# Altium project lga1700.PrjPCB (part 10 of 11)

## Sheet SIO - IT8613E.schdoc
size 420 x 298 mm; Symbol: Sheet-Symbol_A3; Company: 嘉立创EDA; Version: V1.0; Page Size: A3; @Project Name: 【全网首发】X86电脑主板_copy; @Page Count: 12; @Update Date: 2025-10-09; @Create Date: 2025-10-09; @Schematic Name: SCHEMATIC1_1; @Page No: 0; @Page Name: SIO - IT8613E; Device: Sheet-Symbol_A3
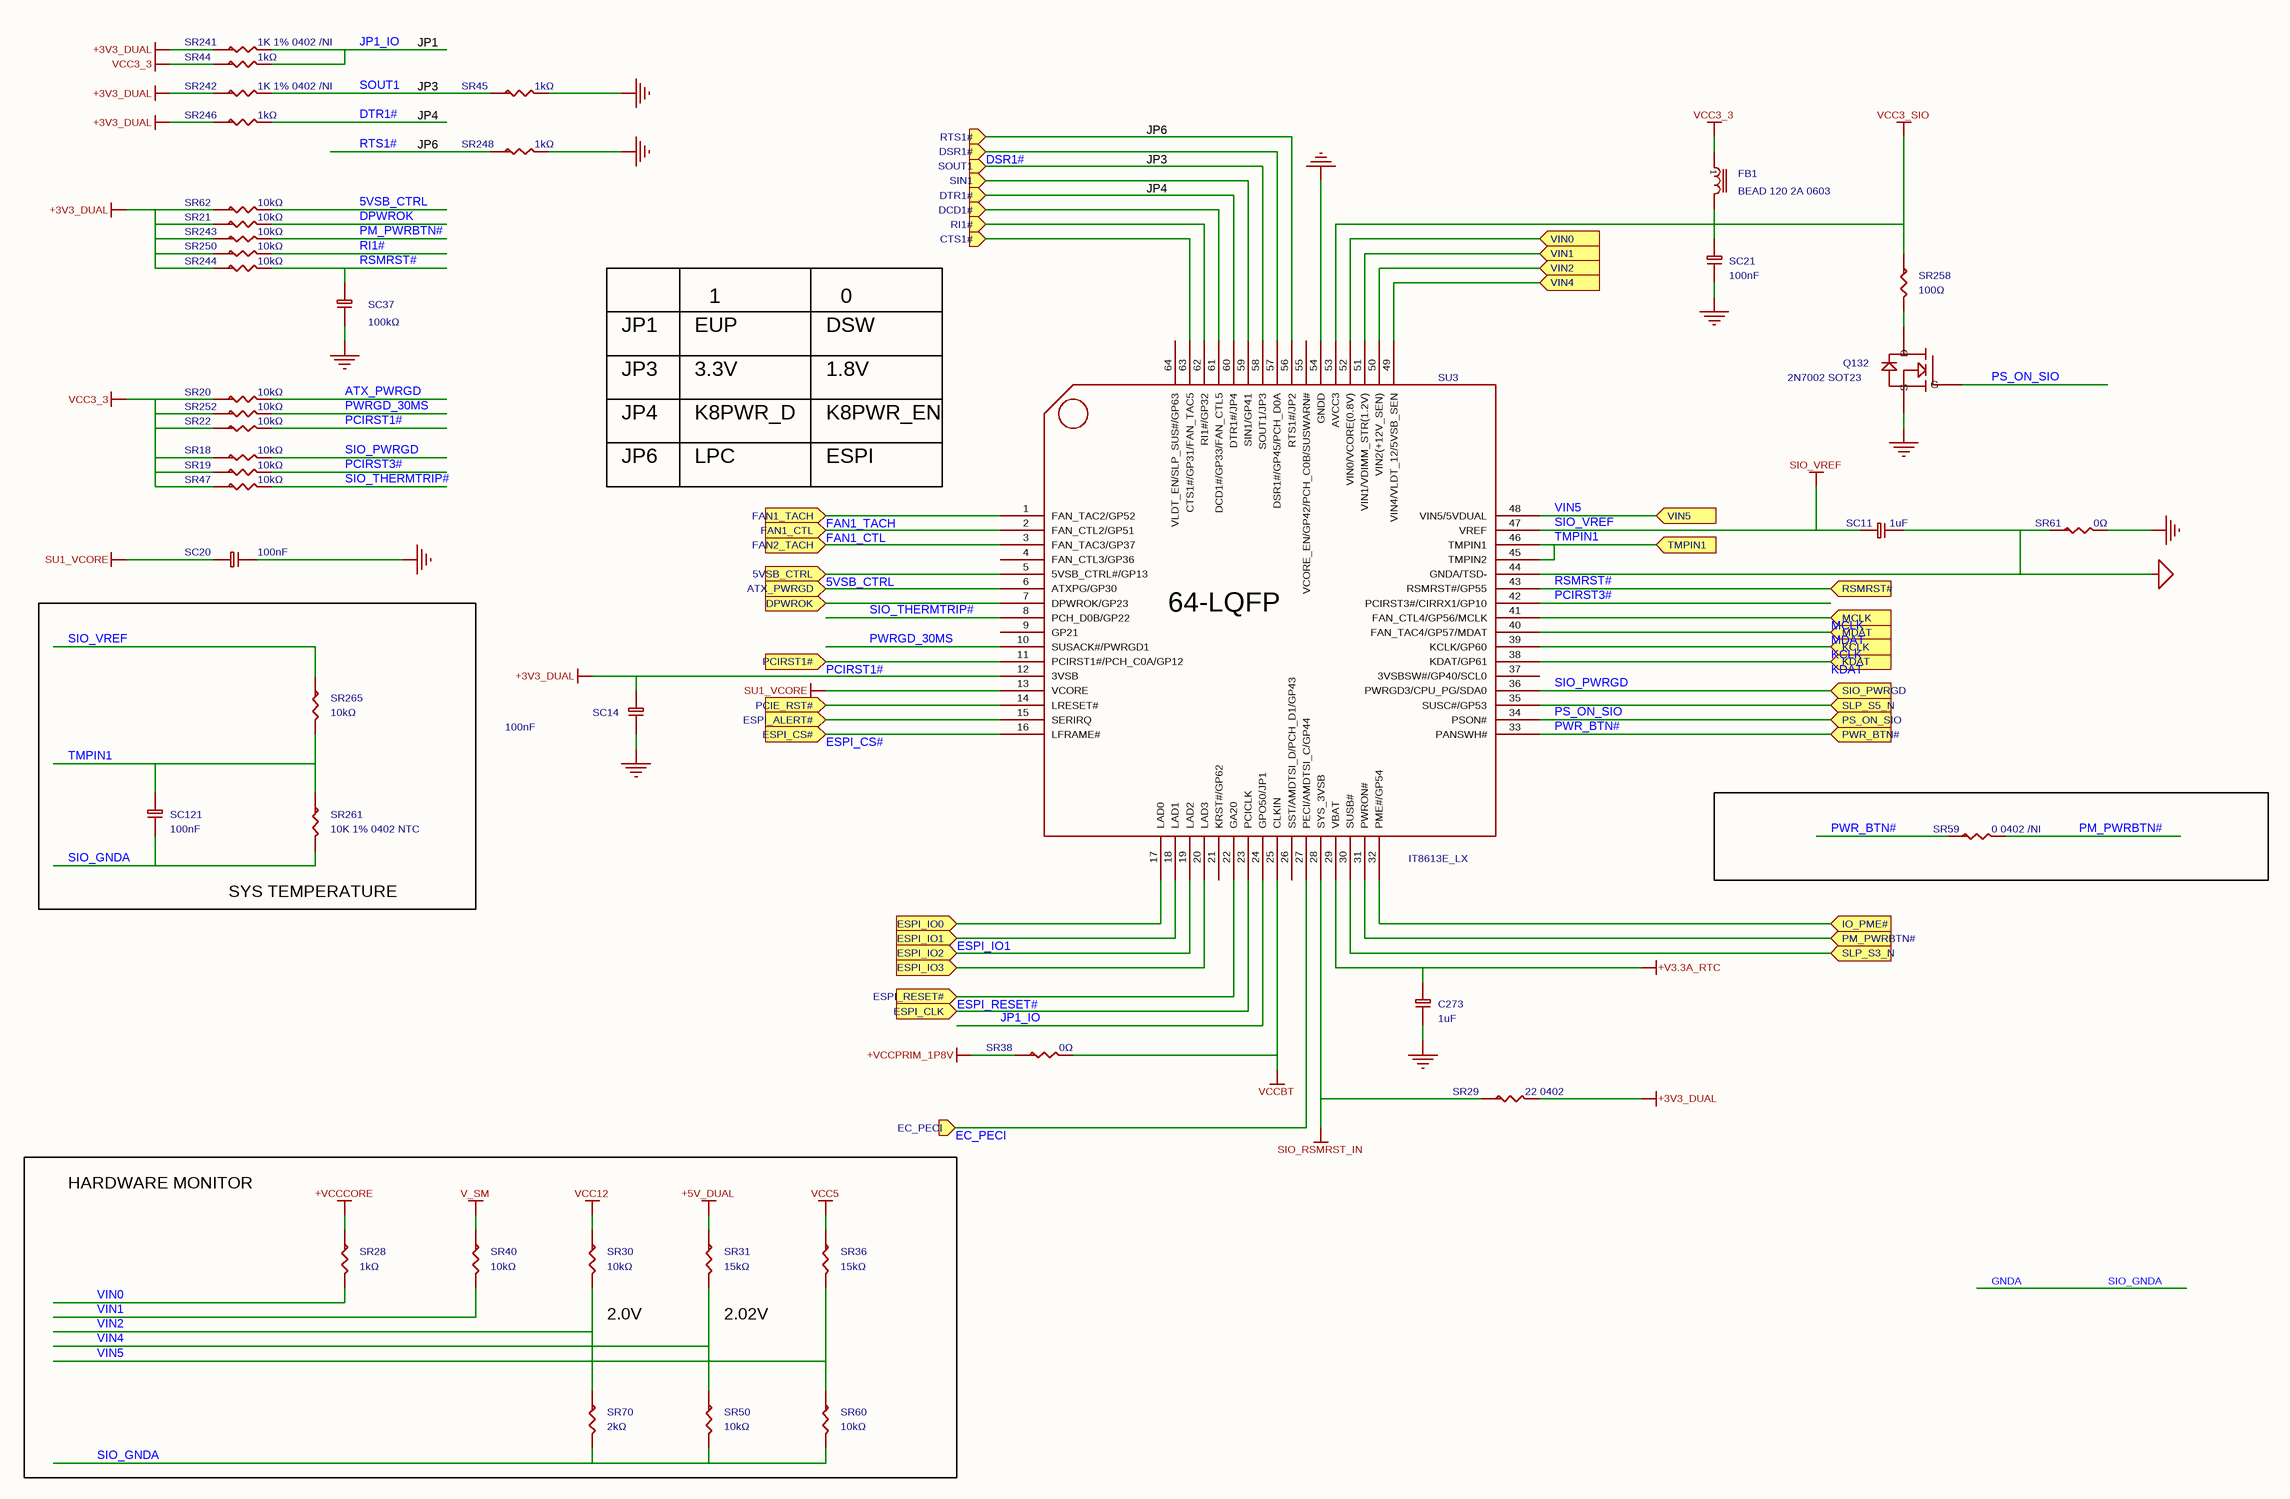
[diagram p30: SIO - IT8613E.schdoc]

### Parts
C273  1uF  [C0402]
FB1  value BEAD 120 2A 0603  [FB0603_1]  (hidden comment: FERRITE BEAD)
Q132  value 2N7002 SOT23  [SOT23_123]  (hidden comment: 2N7002)
SC11  1uF  [C0402]
SC14  100nF  [C0402_2]
SC20  100nF  [C0402_1]
SC21  100nF  [C0402]
SC37  100kΩ  [C0402]
SC121  100nF  [C0402]
SR18  10kΩ  [R0402_2]
SR19  10kΩ  [R0402_3]
SR20  10kΩ  [R0402]
SR21  10kΩ  [R0402]
SR22  10kΩ  [R0402]
SR28  1kΩ  [R0402_2]
SR29  value 22 0402  [R0402_3]  (hidden comment: R-0603)
SR30  10kΩ  [R0402_2]
SR31  15kΩ  [R0402_2]
SR36  15kΩ  [R0402_2]
SR38  0Ω  [R0402_1]
SR40  10kΩ  [R0402_2]
SR44  1kΩ  [R0402_3]
SR45  1kΩ  [R0402_2]
SR47  10kΩ  [R0402_1]
SR50  10kΩ  [R0402]
SR59  value 0 0402 /NI  [R0402]  (hidden comment: R-0603)
SR60  10kΩ  [R0402]
SR61  0Ω  [R0402]
SR62  10kΩ  [R0402]
SR70  2kΩ  [R0402_2]
SR241  value 1K 1% 0402 /NI  [R0402_3]  (hidden comment: R-0603)
SR242  value 1K 1% 0402 /NI  [R0402]  (hidden comment: R-0603)
SR243  10kΩ  [R0402_2]
SR244  10kΩ  [R0402_2]
SR246  1kΩ  [R0402_2]
SR248  1kΩ  [R0402]
SR250  10kΩ  [R0402_2]
SR252  10kΩ  [R0402_1]
SR258  100Ω  [R0402]
SR261  value 10K 1% 0402 NTC  [R0402]  (hidden comment: NCP15XH103F03RC)
SR265  10kΩ  [R0402]
SU3  value IT8613E_LX  [LQFP64_0_4]  (hidden comment: IT8712H_AP_0)

### Blocks framed on the sheet
SYS TEMPERATURE: SC121 SR261 SR265

### Ports
5VSB_CTRL (in), ATX_PWRGD (in), CTS1# (in), DCD1# (in), DPWROK (in), DSR1# (in), DTR1# (in), EC_PECI (in), ESPI_ALERT# (in), ESPI_CLK (in), ESPI_CS# (in), ESPI_IO0 (in), ESPI_IO1 (in), ESPI_IO2 (in), ESPI_IO3 (in), ESPI_RESET# (in), FAN1_CTL (in), FAN1_TACH (in), FAN2_TACH (in), IO_PME# (in), KCLK (in), KDAT (in), MCLK (in), MDAT (in), PCIE_RST# (in), PCIRST1# (in), PM_PWRBTN# (in), PS_ON_SIO (in), PWR_BTN# (in), RI1# (in), RSMRST# (in), RTS1# (in), SIN1 (in), SIO_PWRGD (in), SLP_S3_N (in), SLP_S5_N (in), SOUT1 (in), TMPIN1 (in), VIN0 (in), VIN1 (in), VIN2 (in), VIN4 (in), VIN5 (in)

### Nets
+3V3_DUAL: SC14.2 SR21.1 SR29.2 SR62.1 SR241.1 SR242.1 SR243.1 SR244.1 SR246.1 SR250.1 SU3.12(3VSB)
+5V_DUAL: SR31.1
+V3.3A_RTC: C273.2 SU3.29(VBAT)
+VCCCORE: SR28.1
+VCCPRIM_1P8V: SR38.1
GND: C273.1 Q132.2(S) SC14.1 SC20.1 SC21.1 SC37.1 SR45.2 SR61.2 SR248.2 SU3.54(GNDD)
GNDA: SC11.1 SC121.1 SR50.2 SR60.2 SR61.1 SR70.2 SR261.2 SU3.44(GNDA/TSD-)  [also labelled SIO_GNDA]
SIO_RSMRST_IN: SR29.1 SU3.28(SYS_3VSB)
SIO_VREF: SC11.2 SR265.1 SU3.47(VREF)
SU1_VCORE: SC20.2 SU3.13(VCORE)
V_SM: SR40.1
VCC3_3: FB1.1 SR18.1 SR19.1 SR20.1 SR22.1 SR44.1 SR47.1 SR252.1
VCC3_SIO: FB1.2 SC21.2 SR258.1 SU3.53(AVCC3)
VCC5: SR36.1
VCC12: SR30.1
VCCBT: SR38.2 SU3.25(CLKIN)
5VSB_CTRL: SR62.2 SU3.5(5VSB_CTRL#/GP13) ; port 5VSB_CTRL
ATX_PWRGD: SR20.2
CTS1#: SU3.63(CTS1#/GP31/FAN_TAC5) ; port CTS1#
DCD1#: SU3.61(DCD1#/GP33/FAN_CTL5) ; port DCD1#
DPWROK: SU3.7(DPWROK/GP23) ; port DPWROK
DPWROK: SR21.2  [a separate net that carries the same name]
DSR1#: SU3.57(DSR1#/GP45/PCH_D0A) ; port DSR1#
DTR1#: SU3.60(DTR1#/JP4) ; port DTR1#
DTR1#: SR246.2  [a separate net that carries the same name]
EC_PECI: SU3.27(PECI/AMDTSI_C/GP44) ; port EC_PECI
ESPI_CS#: SU3.16(LFRAME#) ; port ESPI_CS#
ESPI_IO1: SU3.18(LAD1) ; port ESPI_IO1
ESPI_RESET#: SU3.22(GA20) ; port ESPI_RESET#
FAN1_CTL: SU3.2(FAN_CTL2/GP51) ; port FAN1_CTL
FAN1_TACH: SU3.1(FAN_TAC2/GP52) ; port FAN1_TACH
IO_PME#: SU3.32(PME#/GP54) ; port IO_PME#
JP1_IO: SR44.2 SR241.2 SU3.24(GPO50/JP1)
KCLK: SU3.39(KCLK/GP60) ; port KCLK
KDAT: SU3.38(KDAT/GP61) ; port KDAT
MCLK: SU3.41(FAN_CTL4/GP56/MCLK) ; port MCLK
MDAT: SU3.40(FAN_TAC4/GP57/MDAT) ; port MDAT
PCIE_RST#: SU3.14(LRESET#) ; port PCIE_RST#
PCIRST1#: SR22.2 SU3.11(PCIRST1#/PCH_C0A/GP12) ; port PCIRST1#
PCIRST3#: SR19.2 SU3.42(PCIRST3#/CIRRX1/GP10)
PM_PWRBTN#: SU3.31(PWRON#) ; port PM_PWRBTN#
PM_PWRBTN#: SR59.2 SR243.2  [a separate net that carries the same name]
PS_ON_SIO: Q132.1(G) SU3.34(PSON#) ; port PS_ON_SIO
PWR_BTN#: SR59.1 SU3.33(PANSWH#) ; port PWR_BTN#
PWRGD_30MS: SR252.2 SU3.10(SUSACK#/PWRGD1)
RI1#: SU3.62(RI1#/GP32) ; port RI1#
RI1#: SR250.2  [a separate net that carries the same name]
RSMRST#: SC37.2 SR244.2 SU3.43(RSMRST#/GP55) ; port RSMRST#
RTS1#: SU3.56(RTS1#/JP2) ; port RTS1#
RTS1#: SR248.1  [a separate net that carries the same name]
SIN1: SU3.59(SIN1/GP41) ; port SIN1
SIO_PWRGD: SR18.2 SU3.36(PWRGD3/CPU_PG/SDA0) ; port SIO_PWRGD
SIO_THERMTRIP#: SR47.2 SU3.8(PCH_D0B/GP22)
SLP_S3_N: SU3.30(SUSB#) ; port SLP_S3_N
SOUT1: SR45.1 SR242.2
TMPIN1: SC121.2 SR261.1 SR265.2 SU3.45(TMPIN2) SU3.46(TMPIN1) ; port TMPIN1
VIN0: SR28.2
VIN1: SR40.2
VIN2: SR30.2 SR70.1
VIN4: SR31.2 SR50.1
VIN5: SR36.2 SR60.1 SU3.48(VIN5/5VDUAL) ; port VIN5
NetATXPWR1_8: SU3.6(ATXPG/GP30) ; port ATX_PWRGD
NetPCH2_AN4: SU3.35(SUSC#/GP53) ; port SLP_S5_N
NetQ132_3: Q132.3(D) SR258.2
NetSU3_3: SU3.3(FAN_TAC3/GP37) ; port FAN2_TACH
NetSU3_15: SU3.15(SERIRQ) ; port ESPI_ALERT#
NetSU3_17: SU3.17(LAD0) ; port ESPI_IO0
NetSU3_19: SU3.19(LAD2) ; port ESPI_IO2
NetSU3_20: SU3.20(LAD3) ; port ESPI_IO3
NetSU3_23: SU3.23(PCICLK) ; port ESPI_CLK
NetSU3_49: SU3.49(VIN4/VLDT_12/5VSB_SEN) ; port VIN4
NetSU3_50: SU3.50(VIN2(+12V_SEN)) ; port VIN2
NetSU3_51: SU3.51(VIN1/VDIMM_STR(1.2V)) ; port VIN1
NetSU3_52: SU3.52(VIN0/VCORE(0.8V)) ; port VIN0
NetSU3_58: SU3.58(SOUT1/JP3) ; port SOUT1

Not connected (* = marked no-connect by the designer): SU3 4(FAN_CTL3/GP36) 9(GP21) 21(KRST#/GP62) 26(SST/AMDTSI_D/PCH_D1/GP43) 37(3VSBSW#/GP40/SCL0) 55(VCORE_EN/GP42/PCH_C0B/SUSWARN#) 64(VLDT_EN/SLP_SUS#/GP63)

### Notes on the sheet
- JP1
- JP3
- JP4
- JP6
- EUP
- 1
- DSW
- 0
- 3.3V
- K8PWR_D
- 1.8V
- K8PWR_EN
- LPC
- ESPI
- HARDWARE MONITOR
- (near SR30) 2.0V
- (near SR31) 2.02V
- 更新日期
- 2025-10-09
- 原理图
- 图页
- SCHEMATIC1_1
- SIO - IT8613E
- 创建日期
- 物料编码
- 审阅
- 绘制
- 【全网首发】X86电脑主板_copy
- 版本
- V1.0
- 尺寸
- A3
- 页
- 嘉立创EDA
- 共
- 12
- (in symbol IT8712H_AP_0) 64-LQFP

### Library data of the parts
C273 SC11 = CL05A105KQ5NNNC: 容值:1uF;精度:±10%;额定电压:6.3V;材质(温度系数):X5R;; Manufacturer: SAMSUNG(三星); Symbol: C-0603_2; AddInBom: yes; ModelId: 36a51122f27c49738f86b3bfa98863e0; ModelName: C0402_L1.0-W0.5-H0.5; ModelTransform: 39.37,19.685,0,0,0,0,0,0,0; Tolerance: ±10%; Voltage Rated: 6.3V; Temperature Coefficient: X5R; Device: CL05A105KQ5NNNC; Value: 1uF; LCSC Part Name: 1uF ±10% 6.3V; SupplierPart: C107372; ManufacturerPart: CL05A105KQ5NNNC; Supplier Footprint: 0402; JLCPCB Part Class: Extended Part; Datasheet: https://atta.szlcsc.com/upload/public/pdf/source/20160218/1457707763339.pdf; Supplier: LCSC; ConvertToPcb: yes; FootprintName: C0402
FB1 = FERRITE BEAD_2: Check: false; AddInBom: yes; Device: FERRITE BEAD_2; Symbol: FERRITE BEAD; FootprintName: FB0603_1; ConvertToPcb: yes
Q132 = 2N7002_C8545: 类型:N沟道;漏源电压(Vdss):60V;连续漏极电流(Id):115mA;功率(Pd):200mW;导通电阻(RDS(on)@Vgs,Id):7.5Ω@10V,500mA;阈值电压(Vgs(th)@Id):2.5V@250uA;; Manufacturer: CJ(江苏长电/长晶); Symbol: MOS,2N7002,SOT23,60V,300mA_0; Type: N沟道; ModelId: c62791f0466c4ae2a892c056b845b0ca; AddInBom: yes; ModelName: SOT-23-3P_L2.9-W1.3-H1.0-LS2.4-P0.95; ModelTransform: 98.425,114.173,0,180,0,0,0.0005,-0.0005,0; Power Dissipation (Pd): 200mW; Drain Source Voltage (Vdss): 60V; Continuous Drain Current (Id): 115mA; Device: 2N7002_C8545; Supplier: LCSC; Datasheet: https://atta.szlcsc.com/upload/public/pdf/source/20170302/1488422688078.pdf; FootprintName: SOT23_123; SupplierPart: C8545; ConvertToPcb: yes; LCSC Part Name: N沟道 60V 115mA; JLCPCB Part Class: Basic Part; ManufacturerPart: 2N7002; Supplier Footprint: SOT-23; Gate Threshold Voltage (Vgs(th)@Id): 2.5V@250uA; Drain Source On Resistance (RDS(on)@Vgs,Id): 7.5Ω@10V,500mA
SC14 SC20 SC21 SC121 = CL05B104KO5NNNC: 容值:100nF;精度:±10%;额定电压:16V;材质(温度系数):X7R;; Manufacturer: SAMSUNG(三星); Symbol: C-0603_2; ModelId: 36a51122f27c49738f86b3bfa98863e0; Tolerance: ±10%; AddInBom: yes; Voltage Rated: 16V; ModelName: C0402_L1.0-W0.5-H0.5; ModelTransform: 39.37,19.685,0,0,0,0,0,0,0; Temperature Coefficient: X7R; Device: CL05B104KO5NNNC; Value: 100nF; Supplier: LCSC; Datasheet: https://atta.szlcsc.com/upload/public/pdf/source/20160103/1457707674891.pdf; SupplierPart: C1525; ConvertToPcb: yes; LCSC Part Name: 100nF ±10% 16V; JLCPCB Part Class: Basic Part; ManufacturerPart: CL05B104KO5NNNC; Supplier Footprint: 0402
  SC14: FootprintName: C0402_2
  SC20: FootprintName: C0402_1
  SC21 SC121: FootprintName: C0402
SC37 = 0402WGF1003TCE: 电阻类型:厚膜电阻;阻值:100kΩ;精度:±1%;功率:62.5mW;; Manufacturer: UNI-ROYAL(厚声); Symbol: C-0603_0; ModelId: 671aefced39d4c318694bba8bd8efd39; Tolerance: ±1%; AddInBom: yes; Power(Watts): 62.5mW; ModelName: R0402_L1.0-W0.5-H0.5; ModelTransform: 39.37,19.685,0,0,0,0,0,0.0005,0; Overload Voltage (Max): 50V; Temperature Coefficient: ±100ppm/℃; Device: 0402WGF1003TCE; Value: 100kΩ; Type: 厚膜电阻; Supplier: LCSC; Datasheet: https://atta.szlcsc.com/upload/public/pdf/source/20200306/C422600_1E6D84923E4A46A82E41ADD87F860B5C.pdf; FootprintName: C0402; SupplierPart: C25741; ConvertToPcb: yes; LCSC Part Name: 100kΩ ±1% 62.5mW; JLCPCB Part Class: Basic Part; ManufacturerPart: 0402WGF1003TCE; Supplier Footprint: 0402; Operating Temperature Range: -55℃~+155℃
SR18-SR22 SR30 SR40 SR47 SR50 SR60 SR62 SR243 SR244 SR250 SR252 SR265 = 0402WGF1002TCE: 电阻类型:厚膜电阻;阻值:10kΩ;精度:±1%;功率:62.5mW;; Manufacturer: UNI-ROYAL(厚声); Symbol: R-0603; ModelId: 671aefced39d4c318694bba8bd8efd39; Tolerance: ±1%; AddInBom: yes; Power(Watts): 62.5mW; ModelName: R0402_L1.0-W0.5-H0.5; ModelTransform: 39.37,19.685,0,0,0,0,0,0.0005,0; Overload Voltage (Max): 50V; Temperature Coefficient: ±100ppm/℃; Device: 0402WGF1002TCE; Value: 10kΩ; Type: 厚膜电阻; Supplier: LCSC; Datasheet: https://atta.szlcsc.com/upload/public/pdf/source/20200306/C422600_1E6D84923E4A46A82E41ADD87F860B5C.pdf; SupplierPart: C25744; ConvertToPcb: yes; LCSC Part Name: 10kΩ ±1% 62.5mW; JLCPCB Part Class: Basic Part; ManufacturerPart: 0402WGF1002TCE; Supplier Footprint: 0402; Operating Temperature Range: -55℃~+155℃
  SR18 SR30 SR40 SR243 SR244 SR250: FootprintName: R0402_2
  SR19: FootprintName: R0402_3
  SR20-SR22 SR50 SR60 SR62 SR265: FootprintName: R0402
  SR47 SR252: FootprintName: R0402_1
SR28 SR44 SR45 SR246 SR248 = 0402WGF1001TCE: 电阻类型:厚膜电阻;阻值:1kΩ;精度:±1%;功率:62.5mW;; Manufacturer: UNI-ROYAL(厚声); Symbol: R-0603; ModelId: 671aefced39d4c318694bba8bd8efd39; Tolerance: ±1%; AddInBom: yes; Power(Watts): 62.5mW; ModelName: R0402_L1.0-W0.5-H0.5; ModelTransform: 39.37,19.685,0,0,0,0,0,0.0005,0; Overload Voltage (Max): 50V; Temperature Coefficient: ±100ppm/℃; Device: 0402WGF1001TCE; Value: 1kΩ; Type: 厚膜电阻; Supplier: LCSC; Datasheet: https://atta.szlcsc.com/upload/public/pdf/source/20200306/C422600_1E6D84923E4A46A82E41ADD87F860B5C.pdf; SupplierPart: C11702; ConvertToPcb: yes; LCSC Part Name: 1kΩ ±1% 62.5mW; JLCPCB Part Class: Basic Part; ManufacturerPart: 0402WGF1001TCE; Supplier Footprint: 0402; Operating Temperature Range: -55℃~+155℃
  SR28 SR45 SR246: FootprintName: R0402_2
  SR44: FootprintName: R0402_3
  SR248: FootprintName: R0402
SR29 = R-0603: AddInBom: yes; Device: R-0603; Symbol: R-0603; FootprintName: R0402_3; ConvertToPcb: yes
SR31 SR36 = 0402WGF1502TCE: 电阻类型:厚膜电阻;阻值:15kΩ;精度:±1%;功率:62.5mW;; Manufacturer: UNI-ROYAL(厚声); Symbol: R-0603; ModelId: 671aefced39d4c318694bba8bd8efd39; Tolerance: ±1%; AddInBom: yes; Power(Watts): 62.5mW; ModelName: R0402_L1.0-W0.5-H0.5; ModelTransform: 39.37,19.685,0,0,0,0,0,0.0005,0; Overload Voltage (Max): 50V; Temperature Coefficient: ±100ppm/℃; Device: 0402WGF1502TCE; Value: 15kΩ; Type: 厚膜电阻; Supplier: LCSC; Datasheet: https://atta.szlcsc.com/upload/public/pdf/source/20200306/C422600_1E6D84923E4A46A82E41ADD87F860B5C.pdf; FootprintName: R0402_2; SupplierPart: C25756; ConvertToPcb: yes; LCSC Part Name: 15kΩ ±1% 62.5mW; JLCPCB Part Class: Basic Part; ManufacturerPart: 0402WGF1502TCE; Supplier Footprint: 0402; Operating Temperature Range: -55℃~+155℃
SR38 SR61 = 0402WGF0000TCE: 电阻类型:厚膜电阻;阻值:0Ω;精度:±1%;功率:62.5mW;; Manufacturer: UNI-ROYAL(厚声); Symbol: R-0603; ModelId: 671aefced39d4c318694bba8bd8efd39; Tolerance: ±1%; AddInBom: yes; Power(Watts): 62.5mW; ModelName: R0402_L1.0-W0.5-H0.5; ModelTransform: 39.37,19.685,0,0,0,0,0,0.0005,0; Overload Voltage (Max): 50V; Temperature Coefficient: ±800ppm/℃; Device: 0402WGF0000TCE; Value: 0Ω; Type: 厚膜电阻; Supplier: LCSC; Datasheet: https://atta.szlcsc.com/upload/public/pdf/source/20200306/C422600_1E6D84923E4A46A82E41ADD87F860B5C.pdf; SupplierPart: C17168; ConvertToPcb: yes; LCSC Part Name: 0Ω ±1% 62.5mW; JLCPCB Part Class: Basic Part; ManufacturerPart: 0402WGF0000TCE; Supplier Footprint: 0402; Operating Temperature Range: -55℃~+155℃
  SR38: FootprintName: R0402_1
  SR61: FootprintName: R0402
SR59 SR242 = R-0603_1: Check: false; AddInBom: yes; Device: R-0603_1; Symbol: R-0603; FootprintName: R0402; ConvertToPcb: yes
SR70 = 0402WGF2001TCE: 电阻类型:厚膜电阻;阻值:2kΩ;精度:±1%;功率:62.5mW;; Manufacturer: UNI-ROYAL(厚声); Symbol: R-0603; ModelId: 671aefced39d4c318694bba8bd8efd39; Tolerance: ±1%; AddInBom: yes; Power(Watts): 62.5mW; ModelName: R0402_L1.0-W0.5-H0.5; ModelTransform: 39.37,19.685,0,0,0,0,0,0.0005,0; Overload Voltage (Max): 50V; Temperature Coefficient: ±100ppm/℃; Device: 0402WGF2001TCE; Value: 2kΩ; Type: 厚膜电阻; Supplier: LCSC; Datasheet: https://atta.szlcsc.com/upload/public/pdf/source/20200306/C422600_1E6D84923E4A46A82E41ADD87F860B5C.pdf; FootprintName: R0402_2; SupplierPart: C4109; ConvertToPcb: yes; LCSC Part Name: 2kΩ ±1% 62.5mW; JLCPCB Part Class: Basic Part; ManufacturerPart: 0402WGF2001TCE; Supplier Footprint: 0402; Operating Temperature Range: -55℃~+155℃
SR241 = R-0603: Check: false; AddInBom: yes; Device: R-0603; Symbol: R-0603; FootprintName: R0402_3; ConvertToPcb: yes
SR258 = 0402WGF1000TCE: 电阻类型:厚膜电阻;阻值:100Ω;精度:±1%;功率:62.5mW;; Manufacturer: UNI-ROYAL(厚声); Symbol: R-0603; ModelId: 671aefced39d4c318694bba8bd8efd39; Tolerance: ±1%; AddInBom: yes; Power(Watts): 62.5mW; ModelName: R0402_L1.0-W0.5-H0.5; ModelTransform: 39.37,19.685,0,0,0,0,0,0.0005,0; Overload Voltage (Max): 50V; Temperature Coefficient: ±200ppm/℃; Device: 0402WGF1000TCE; Value: 100Ω; Type: 厚膜电阻; Supplier: LCSC; Datasheet: https://atta.szlcsc.com/upload/public/pdf/source/20200306/C422600_1E6D84923E4A46A82E41ADD87F860B5C.pdf; FootprintName: R0402; SupplierPart: C25076; ConvertToPcb: yes; LCSC Part Name: 100Ω ±1% 62.5mW; JLCPCB Part Class: Basic Part; ManufacturerPart: 0402WGF1000TCE; Supplier Footprint: 0402; Operating Temperature Range: -55℃~+155℃
SR261 = NCP15XH103F03RC: 阻值(25℃):10kΩ;B值(25℃/50℃):3380K;电阻精度:±1%;功率:100mW;B值精度:±1%;最大稳态电流(25℃):310uA;; Manufacturer: muRata(村田); Symbol: R-0603; AddInBom: yes; ModelId: 671aefced39d4c318694bba8bd8efd39; ModelName: R0402_L1.0-W0.5-H0.5; ModelTransform: 39.37,19.685,0,0,0,0,0,0.0005,0; Resistance @ 25℃: 10kΩ; B Constant (25℃/50℃): 3380K; Resistance Tolerance: ±1%; B Constant (25℃/85℃): 3434K; B Constant (25℃/100℃): 3455K; Power: 100mW; Steady State Current (Max): 310uA; Device: NCP15XH103F03RC; LCSC Part Name: 10kΩ 电阻精度:±1% 3380K; SupplierPart: C77131; ManufacturerPart: NCP15XH103F03RC; Supplier Footprint: 0402; JLCPCB Part Class: Extended Part; Datasheet: https://atta.szlcsc.com/upload/public/pdf/source/20191017/C437581_F6360BF8E6A38281D0EED84DF6C92458.pdf; Supplier: LCSC; ConvertToPcb: yes; FootprintName: R0402; B Constant (25℃/75℃): -; B Constant Tolerance: ±1%; Operating Temperature: -40℃~+125℃
SU3 = IT8712H_AP_0: Check: false; AddInBom: yes; Device: IT8712H_AP_0; Symbol: IT8712H_AP_0; FootprintName: LQFP64_0_4; ConvertToPcb: yes

## Sheet SIO - IT8784E.schdoc
size 297 x 210 mm; Symbol: Sheet-Symbol_A4; Company: 嘉立创EDA; Version: V1.0; Page Size: A4; @Project Name: 【全网首发】X86电脑主板_copy; @Page Count: 13; @Update Date: 2025-10-09; @Create Date: 2025-10-09; @Schematic Name: SCHEMATIC1_1; @Page No: 0; @Page Name: SIO - IT8784E; Device: Sheet-Symbol_A4_1
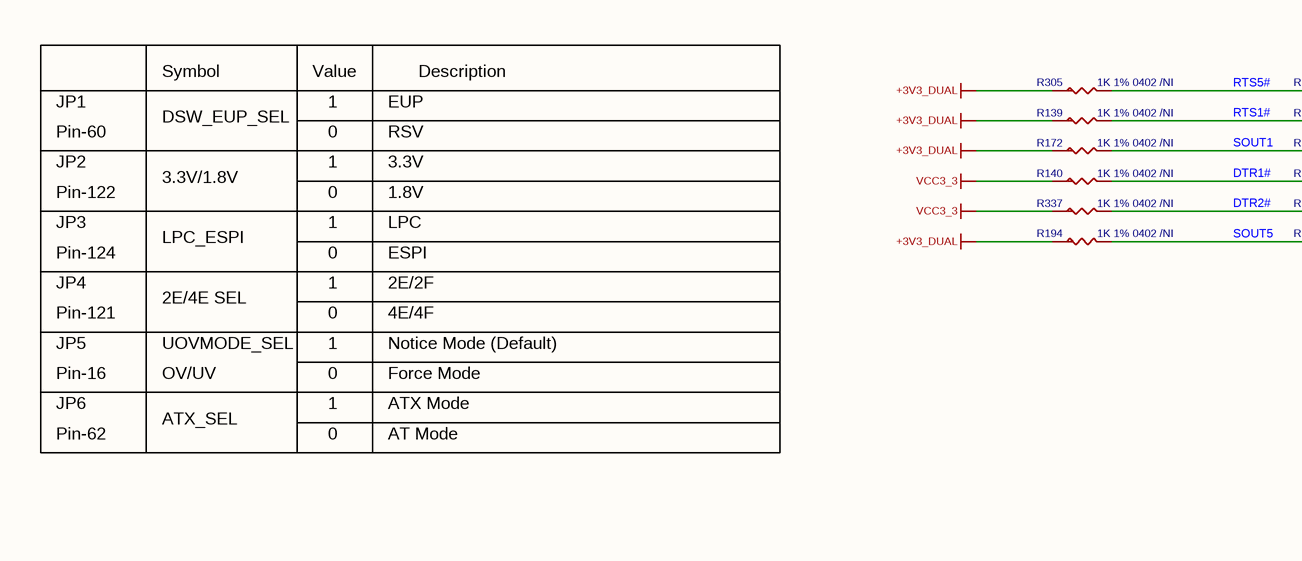
[diagram p31: SIO - IT8784E.schdoc, left]
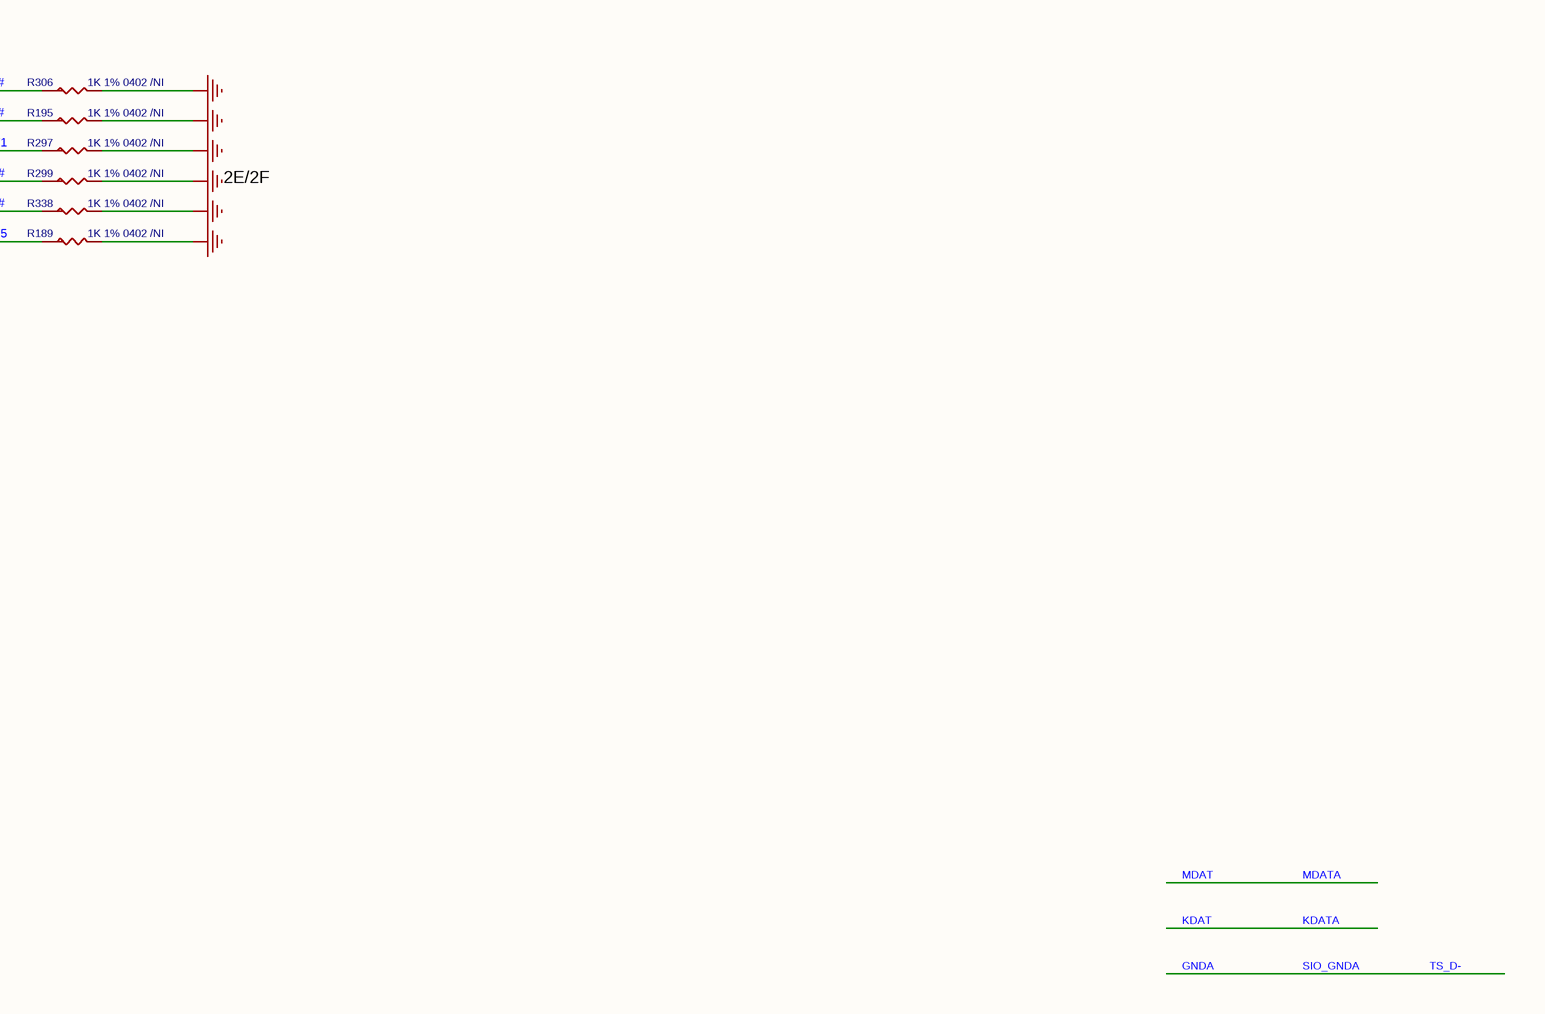
[diagram p32: SIO - IT8784E.schdoc, right]

### Parts
R139  value 1K 1% 0402 /NI  [R0402_2]  (hidden comment: R)
R140  value 1K 1% 0402 /NI  [R0402_2]  (hidden comment: R)
R172  value 1K 1% 0402 /NI  [R0402]  (hidden comment: R)
R189  value 1K 1% 0402 /NI  [R0402_1]  (hidden comment: R)
R194  value 1K 1% 0402 /NI  [R0402_3]  (hidden comment: R)
R195  value 1K 1% 0402 /NI  [R0402]  (hidden comment: R)
R297  value 1K 1% 0402 /NI  [R0402_2]  (hidden comment: R)
R299  value 1K 1% 0402 /NI  [R0402]  (hidden comment: R)
R305  value 1K 1% 0402 /NI  [R0402_3]  (hidden comment: R)
R306  value 1K 1% 0402 /NI  [R0402_1]  (hidden comment: R)
R337  value 1K 1% 0402 /NI  [R0402]  (hidden comment: R)
R338  value 1K 1% 0402 /NI  [R0402]  (hidden comment: R)

### Nets
+3V3_DUAL: R139.1 R172.1 R194.1 R305.1
GND: R189.2 R195.2 R297.2 R299.2 R306.2 R338.2
VCC3_3: R140.1 R337.1
DTR1#: R140.2 R299.1
DTR2#: R337.2 R338.1
RTS1#: R139.2 R195.1
RTS5#: R305.2 R306.1
SOUT1: R172.2 R297.1
SOUT5: R189.1 R194.2

### Notes on the sheet
- JP1
- Pin-60
- Symbol
- DSW_EUP_SEL
- Value
- 1
- 0
- EUP
- RSV
- Description
- Pin-122
- JP2
- 3.3V/1.8V
- 1.8V
- 3.3V
- 2E/2F
- JP3
- JP4
- Pin-124
- LPC_ESPI
- LPC
- ESPI
- Pin-121
- JP5
- 2E/4E SEL
- UOVMODE_SEL
- 4E/4F
- Notice Mode (Default)
- JP6
- Pin-62
- Pin-16
- ATX_SEL
- OV/UV
- ATX Mode
- AT Mode
- Force Mode
- 更新日期
- 2025-10-09
- 原理图
- 图页
- SCHEMATIC1_1
- SIO - IT8784E
- 创建日期
- 物料编码
- 审阅
- 绘制
- 【全网首发】X86电脑主板_copy
- 版本
- V1.0
- 尺寸
- A4
- 页
- 嘉立创EDA
- 共
- 13

### Library data of the parts
R139 R140 R297 = R_4: Manufacturer: UNI-ROYAL(厚声); Manufacturer Part: 0402WGF1001TCE; 3D Model: 671aefced39d4c318694bba8bd8efd39; 3D Model Transform: 39.37,19.685,0,0,0,0,0,0.0005,0; Tolerance: ±1%; Power(Watts): 62.5mW; Overload Voltage (Max): 50V; Temperature Coefficient: ±100ppm/℃; AddInBom: yes; Device: R_4; Symbol: R; LCSC Part Name: 1kΩ ±1% 62.5mW 厚膜电阻; Supplier Part: C11702; Supplier Footprint: 0402; JLCPCB Part Class: Basic Part; Datasheet: https://atta.szlcsc.com/upload/public/pdf/source/20200306/C422600_1E6D84923E4A46A82E41ADD87F860B5C.pdf; Supplier: LCSC; Type: 厚膜电阻; Operating Temperature Range: -55℃~+155℃; FootprintName: R0402_2; ConvertToPcb: yes
R172 R195 R299 R337 R338 = R: Manufacturer: UNI-ROYAL(厚声); Manufacturer Part: 0402WGF1001TCE; 3D Model: 671aefced39d4c318694bba8bd8efd39; 3D Model Transform: 39.37,19.685,0,0,0,0,0,0.0005,0; Tolerance: ±1%; Power(Watts): 62.5mW; Overload Voltage (Max): 50V; Temperature Coefficient: ±100ppm/℃; AddInBom: yes; Device: R; Symbol: R; LCSC Part Name: 1kΩ ±1% 62.5mW 厚膜电阻; Supplier Part: C11702; Supplier Footprint: 0402; JLCPCB Part Class: Basic Part; Datasheet: https://atta.szlcsc.com/upload/public/pdf/source/20200306/C422600_1E6D84923E4A46A82E41ADD87F860B5C.pdf; Supplier: LCSC; Type: 厚膜电阻; Operating Temperature Range: -55℃~+155℃; FootprintName: R0402; ConvertToPcb: yes
R189 R306 = R_3: Manufacturer: UNI-ROYAL(厚声); Manufacturer Part: 0402WGF1001TCE; 3D Model: 671aefced39d4c318694bba8bd8efd39; 3D Model Transform: 39.37,19.685,0,0,0,0,0,0.0005,0; Tolerance: ±1%; Power(Watts): 62.5mW; Overload Voltage (Max): 50V; Temperature Coefficient: ±100ppm/℃; AddInBom: yes; Device: R_3; Symbol: R; LCSC Part Name: 1kΩ ±1% 62.5mW 厚膜电阻; Supplier Part: C11702; Supplier Footprint: 0402; JLCPCB Part Class: Basic Part; Datasheet: https://atta.szlcsc.com/upload/public/pdf/source/20200306/C422600_1E6D84923E4A46A82E41ADD87F860B5C.pdf; Supplier: LCSC; Type: 厚膜电阻; Operating Temperature Range: -55℃~+155℃; FootprintName: R0402_1; ConvertToPcb: yes
R194 R305 = R_5: Manufacturer: UNI-ROYAL(厚声); Manufacturer Part: 0402WGF1001TCE; 3D Model: 671aefced39d4c318694bba8bd8efd39; 3D Model Transform: 39.37,19.685,0,0,0,0,0,0.0005,0; Tolerance: ±1%; Power(Watts): 62.5mW; Overload Voltage (Max): 50V; Temperature Coefficient: ±100ppm/℃; AddInBom: yes; Device: R_5; Symbol: R; LCSC Part Name: 1kΩ ±1% 62.5mW 厚膜电阻; Supplier Part: C11702; Supplier Footprint: 0402; JLCPCB Part Class: Basic Part; Datasheet: https://atta.szlcsc.com/upload/public/pdf/source/20200306/C422600_1E6D84923E4A46A82E41ADD87F860B5C.pdf; Supplier: LCSC; Type: 厚膜电阻; Operating Temperature Range: -55℃~+155℃; FootprintName: R0402_3; ConvertToPcb: yes

## Sheet USB32 GEN1 5G_FRONT.schdoc
size 420 x 298 mm; Symbol: Sheet-Symbol_A3; Company: 嘉立创EDA; Version: V1.0; Page Size: A3; @Project Name: H610(2024/12/09); @Page Count: 36; @Update Date: 2025-10-09; @Create Date: 2025-10-09; @Schematic Name: SCHEMATIC1; @Page No: 25; @Page Name: USB32 GEN1 5G_FRONT; Device: Sheet-Symbol_A3; @Board Name: SCHEMATIC1; @Create Time: 10:15:42; @Update Time: 10:18:20
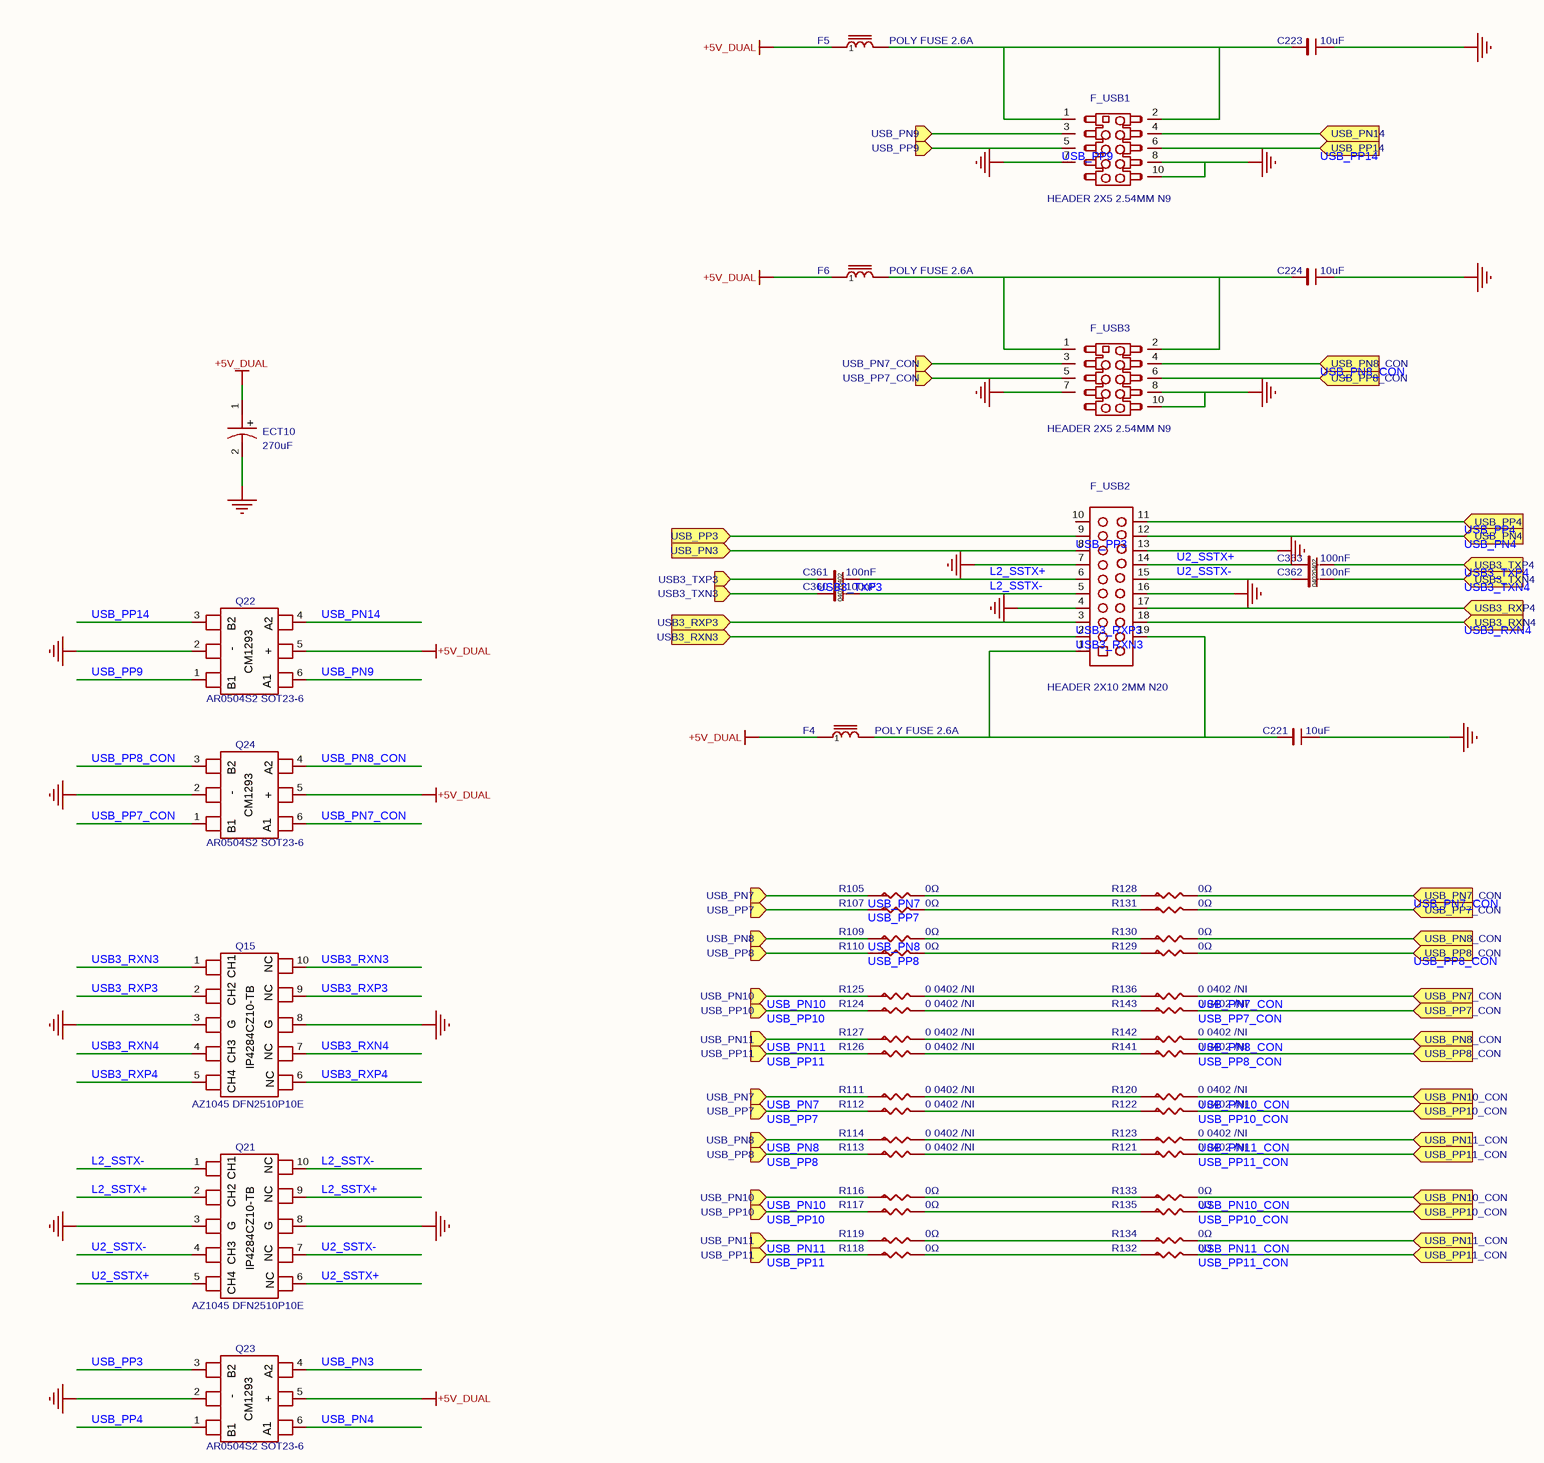
[diagram p33: USB32 GEN1 5G_FRONT.schdoc]

### Parts
C221  10uF  [C0603_1]
C223  10uF  [C0603_2]
C224  10uF  [C0603_1]
C360  100nF  [C0402_1]
C361  100nF  [C0402_1]
C362  100nF  [C0402_3]
C363  100nF  [C0402_3]
ECT10  270uF  [EC1P25C_2]
F4  value POLY FUSE 2.6A  [MINISMDC110]  (hidden comment: FERRITE BEAD)
F5  value POLY FUSE 2.6A  [MINISMDC110]  (hidden comment: FERRITE BEAD)
F6  value POLY FUSE 2.6A  [MINISMDC110]  (hidden comment: FERRITE BEAD)
F_USB1  value HEADER 2X5 2.54MM N9  [HDR-TH_10P-P2.54_210-82-05GB04]  (hidden comment: 210-82-05GB04)
F_USB2  value HEADER 2X10 2MM N20  [HEADER10X2_2MM_USB3_A]  (hidden comment: FRONT USB_0)
F_USB3  value HEADER 2X5 2.54MM N9  [HDR-TH_10P-P2.54_210-82-05GB04]  (hidden comment: 210-82-05GB04)
Q15  value AZ1045 DFN2510P10E  [DFN2510P10E_2]  (hidden comment: AZ1045-04F)
Q21  value AZ1045 DFN2510P10E  [DFN2510P10E_2]  (hidden comment: AZ1045-04F)
Q22  value AR0504S2 SOT23-6  [SOT23-6P-20051228]  (hidden comment: SRV05-4)
Q23  value AR0504S2 SOT23-6  [SOT23-6P-20051228]  (hidden comment: SRV05-4)
Q24  value AR0504S2 SOT23-6  [SOT23-6P-20051228]  (hidden comment: SRV05-4)
R105  0Ω  [R0402]
R107  0Ω  [R0402]
R109  0Ω  [R0402]
R110  0Ω  [R0402]
R111  value 0 0402 /NI  [R0402_2]  (hidden comment: 42A**-F)
R112  value 0 0402 /NI  [R0402_2]  (hidden comment: 42A**-F)
R113  value 0 0402 /NI  [R0402_2]  (hidden comment: 42A**-F)
R114  value 0 0402 /NI  [R0402_2]  (hidden comment: 42A**-F)
R116  0Ω  [R0402]
R117  0Ω  [R0402]
R118  0Ω  [R0402]
R119  0Ω  [R0402]
R120  value 0 0402 /NI  [R0402_2]  (hidden comment: 42A**-F)
R121  value 0 0402 /NI  [R0402_2]  (hidden comment: 42A**-F)
R122  value 0 0402 /NI  [R0402_2]  (hidden comment: 42A**-F)
R123  value 0 0402 /NI  [R0402_2]  (hidden comment: 42A**-F)
R124  value 0 0402 /NI  [R0402_2]  (hidden comment: 42A**-F)
R125  value 0 0402 /NI  [R0402_2]  (hidden comment: 42A**-F)
R126  value 0 0402 /NI  [R0402_2]  (hidden comment: 42A**-F)
R127  value 0 0402 /NI  [R0402_2]  (hidden comment: 42A**-F)
R128  0Ω  [R0402]
R129  0Ω  [R0402]
R130  0Ω  [R0402]
R131  0Ω  [R0402]
R132  0Ω  [R0402]
R133  0Ω  [R0402]
R134  0Ω  [R0402]
R135  0Ω  [R0402]
R136  value 0 0402 /NI  [R0402_2]  (hidden comment: 42A**-F)
R141  value 0 0402 /NI  [R0402_2]  (hidden comment: 42A**-F)
R142  value 0 0402 /NI  [R0402_2]  (hidden comment: 42A**-F)
R143  value 0 0402 /NI  [R0402_2]  (hidden comment: 42A**-F)

### Ports
USB3_RXN3 (in), USB3_RXN4 (in), USB3_RXP3 (in), USB3_RXP4 (in), USB3_TXN3 (in), USB3_TXN4 (in), USB3_TXP3 (in), USB3_TXP4 (in), USB_PN3 (in), USB_PN4 (in), USB_PN7 (in), USB_PN7_CON (in), USB_PN8 (in), USB_PN8_CON (in), USB_PN9 (in), USB_PN10 (in), USB_PN10_CON (in), USB_PN11 (in), USB_PN11_CON (in), USB_PN14 (in), USB_PP3 (in), USB_PP4 (in), USB_PP7 (in), USB_PP7_CON (in), USB_PP8 (in), USB_PP8_CON (in), USB_PP9 (in), USB_PP10 (in), USB_PP10_CON (in), USB_PP11 (in), USB_PP11_CON (in), USB_PP14 (in)

### Nets
+5V_DUAL: ECT10.1 F4.1 F5.1 F6.1 Q22.5(+) Q23.5(+) Q24.5(+)
GND: C221.2 C223.2 C224.2 ECT10.2 F_USB1.7 F_USB1.8 F_USB1.10 F_USB2.4 F_USB2.7 F_USB2.13 F_USB2.16 F_USB3.7 F_USB3.8 F_USB3.10 Q15.3 Q15.8 Q21.3 Q21.8 Q22.2 Q23.2 Q24.2
L2_SSTX+: C361.2 F_USB2.6 Q21.2 Q21.9
L2_SSTX-: C360.2 F_USB2.5 Q21.1 Q21.10
U2_SSTX+: C363.1 F_USB2.14 Q21.5(+) Q21.6
U2_SSTX-: C362.1 F_USB2.15 Q21.4 Q21.7
USB3_RXN3: F_USB2.2 Q15.1 Q15.10 ; port USB3_RXN3
USB3_RXN4: F_USB2.18 Q15.4 Q15.7 ; port USB3_RXN4
USB3_RXP3: F_USB2.3 Q15.2 Q15.9 ; port USB3_RXP3
USB3_RXP4: Q15.5(+) Q15.6
USB3_TXN4: C362.2 ; port USB3_TXN4
USB3_TXP3: C361.1 ; port USB3_TXP3
USB3_TXP4: C363.2 ; port USB3_TXP4
USB_PN3: Q23.4
USB_PN4: F_USB2.12 Q23.6 ; port USB_PN4
USB_PN7: R105.1 R111.1 ; port USB_PN7
USB_PN7_CON: F_USB3.3 Q24.6 R128.2 R136.2 ; port USB_PN7_CON
USB_PN8: R109.1 R114.1 ; port USB_PN8
USB_PN8_CON: F_USB3.4 Q24.4 R130.2 R142.2 ; port USB_PN8_CON
USB_PN9: Q22.6
USB_PN10: R116.1 R125.1 ; port USB_PN10
USB_PN10_CON: R120.2 R133.2 ; port USB_PN10_CON
USB_PN11: R119.1 R127.1 ; port USB_PN11
USB_PN11_CON: R123.2 R134.2 ; port USB_PN11_CON
USB_PN14: Q22.4
USB_PP3: F_USB2.9 Q23.3 ; port USB_PP3
USB_PP4: F_USB2.11 Q23.1 ; port USB_PP4
USB_PP7: R107.1 R112.1 ; port USB_PP7
USB_PP7_CON: F_USB3.5 Q24.1 R131.2 R143.2 ; port USB_PP7_CON
USB_PP8: R110.1 R113.1 ; port USB_PP8
USB_PP8_CON: F_USB3.6 Q24.3 R129.2 R141.2 ; port USB_PP8_CON
USB_PP9: F_USB1.5 Q22.1 ; port USB_PP9
USB_PP10: R117.1 R124.1 ; port USB_PP10
USB_PP10_CON: R122.2 R135.2 ; port USB_PP10_CON
USB_PP11: R118.1 R126.1 ; port USB_PP11
USB_PP11_CON: R121.2 R132.2 ; port USB_PP11_CON
USB_PP14: F_USB1.6 Q22.3 ; port USB_PP14
NetC221_1: C221.1 F4.2 F_USB2.1 F_USB2.19
NetC223_1: C223.1 F5.2 F_USB1.1 F_USB1.2
NetC224_1: C224.1 F6.2 F_USB3.1 F_USB3.2
NetC360_1: C360.1 ; port USB3_TXN3
NetF_USB1_3: F_USB1.3 ; port USB_PN9
NetF_USB1_4: F_USB1.4 ; port USB_PN14
NetF_USB2_8: F_USB2.8 ; port USB_PN3
NetF_USB2_17: F_USB2.17 ; port USB3_RXP4
NetR105_2: R105.2 R128.1
NetR107_2: R107.2 R131.1
NetR109_2: R109.2 R130.1
NetR110_2: R110.2 R129.1
NetR111_2: R111.2 R120.1
NetR112_2: R112.2 R122.1
NetR113_2: R113.2 R121.1
NetR114_2: R114.2 R123.1
NetR116_2: R116.2 R133.1
NetR117_2: R117.2 R135.1
NetR118_2: R118.2 R132.1
NetR119_2: R119.2 R134.1
NetR124_2: R124.2 R143.1
NetR125_2: R125.2 R136.1
NetR126_2: R126.2 R141.1
NetR127_2: R127.2 R142.1

Not connected (* = marked no-connect by the designer): F_USB2 10

### Notes on the sheet
- 更新日期
- 2025-10-09
- 原理图
- 图页
- SCHEMATIC1
- USB32 GEN1 5G_FRONT
- 创建日期
- 物料编码
- 审阅
- 绘制
- H610(2024/12/09)
- 版本
- V1.0
- 尺寸
- A3
- 页
- 25
- 嘉立创EDA
- 共
- 36
- (in symbol 160AREC271M0609) +
- (in symbol AZ1045-04F) CH1; NC; CH2; G; CH3; IP4284CZ10-TB; CH4
- (in symbol SRV05-4_C558418) B2; A2; CM1293; -; B1; A1

### Library data of the parts
C221 C223 C224 = CL10A106KP8NNNC: 容值:10uF;精度:±10%;额定电压:10V;材质(温度系数):X5R;; Manufacturer: SAMSUNG(三星); Symbol: C0805; ModelId: ac125912035d415993ca9572d50418b1; Tolerance: ±10%; AddInBom: yes; Voltage Rated: 10V; ModelName: C0603_L1.6-W0.8-H0.8; ModelTransform: 62.992,31.496,0,0,0,0,0,0,0; Temperature Coefficient: X5R; Device: CL10A106KP8NNNC; Value: 10uF; Supplier: LCSC; Datasheet: https://atta.szlcsc.com/upload/public/pdf/source/20160103/1457707703378.pdf; SupplierPart: C19702; ConvertToPcb: yes; LCSC Part Name: 10uF ±10% 10V; JLCPCB Part Class: Basic Part; ManufacturerPart: CL10A106KP8NNNC; Supplier Footprint: 0603
  C221 C224: FootprintName: C0603_1
  C223: FootprintName: C0603_2
C360-C363 = CL05B104KO5NNNC: 容值:100nF;精度:±10%;额定电压:16V;材质(温度系数):X7R;; Manufacturer: SAMSUNG(三星); Symbol: C0402; ModelId: 36a51122f27c49738f86b3bfa98863e0; Tolerance: ±10%; AddInBom: yes; Voltage Rated: 16V; ModelName: C0402_L1.0-W0.5-H0.5; ModelTransform: 39.37,19.685,0,0,0,0,0,0,0; Temperature Coefficient: X7R; Device: CL05B104KO5NNNC; Value: 100nF; Supplier: LCSC; Datasheet: https://atta.szlcsc.com/upload/public/pdf/source/20160103/1457707674891.pdf; SupplierPart: C1525; ConvertToPcb: yes; LCSC Part Name: 100nF ±10% 16V; JLCPCB Part Class: Basic Part; ManufacturerPart: CL05B104KO5NNNC; Supplier Footprint: 0402
  C360 C361: FootprintName: C0402_1
  C362 C363: FootprintName: C0402_3
ECT10 = 160AREC271M0609: 容值:270uF;精度:±20%;额定电压:16V;纹波电流:3.8A@100kHz;等效串联电阻:15mΩ@100kHz~300kHz;类型:-;; Manufacturer: APAQ(钰邦); Symbol: CAPACITOR POL_0; AddInBom: yes; ModelId: 0a4db4bf24b443b3be4905be97ff10c5; ModelName: CAP-TH_BD6.3-P2.50-D1.0-FD; ModelTransform: 248.4247,247.99777,0,0,0,0,0,0,-137.795; Tolerance: ±20%; Rated Voltage: 16V; φD: 6.3mm; L: 9mm; Lifetime @ Temp: 2000hrs@105℃; Device: 160AREC271M0609; Value: 270uF; LCSC Part Name: 270uF ±20% 16V; SupplierPart: C176312; ManufacturerPart: 160AREC271M0609; Supplier Footprint: 插件,D6.3xL9mm; JLCPCB Part Class: Extended Part; Datasheet: https://atta.szlcsc.com/upload/public/pdf/source/20180420/C176312_A6CC051F3F5535015096354530D22B11.pdf; Supplier: LCSC; ConvertToPcb: yes; FootprintName: EC1P25C_2; Ripple Current: 3.8A@100kHz; Equivalent Series Resistance(ESR): 15mΩ@100kHz~300kHz; Type: -; Lead Spacing: 2.5mm; Operating Temperature: -55℃~+105℃
F4-F6 = FERRITE BEAD_3: Check: false; AddInBom: yes; Device: FERRITE BEAD_3; Symbol: FERRITE BEAD; FootprintName: MINISMDC110; ConvertToPcb: yes
F_USB1 F_USB3 = 210-82-05GB04: 插针结构:2x5P;间距:2.54mm;行距:2.54mm;圆针/方针:方针;安装类型:直插;排数:双排;总PIN位数:10P;额定电流:3A;额定电压:-;配合针长度:6.1mm;塑高:2.5mm;端接针长度:3mm;触头材质:黄铜;触头镀层:-;工作温度范围:-40℃~+105℃;颜色:黑色;; Manufacturer: PINREX(频锐科技); Symbol: PIN HEADER 2X7 2_1.54; AddInBom: yes; ModelId: 31e5a6c7bb854324bc4de0ff3146e549; ModelTransform: 490.157,196.85,0,0,0,0,0,0,-118.11; Pin Structure: 2x5P; Pitch: 2.54mm; Circluar Pins/Square Pins: 方针; Current Rating (Max): 3A; Device: 210-82-05GB04; JLCPCB Part Class: Extended Part; LCSC Part Name: 间距:2.54mm 2x5P 直插 方针 黑金; SupplierPart: C390686; ManufacturerPart: 210-82-05GB04; Supplier Footprint: 插件,P=2.54mm; Datasheet: https://atta.szlcsc.com/upload/public/pdf/source/20190506/C390686_AFD667042634CF7F90D18338E0712651.pdf; Supplier: LCSC; ConvertToPcb: yes; FootprintName: HDR-TH_10P-P2.54_210-82-05GB04; ModelName: HDR-TH_10P-P2.54_210-82-05GB04; Row Spacing: 2.54mm; Mounting Type: 直插; Number of Rows: 双排; Number of Pins: 10P; Voltage Rating (Max): -; Length of Mating Pin: 6.1mm; Insulation Height: 2.5mm; Length of End Connection Pin: 3mm; Contact Material: 黄铜; Contact Plating: -; Operating Temperature Range: -40℃~+105℃; Color: 黑色
F_USB2 = FRONT USB_0: Check: false; AddInBom: yes; Device: FRONT USB_0; Symbol: FRONT USB_0; FootprintName: HEADER10X2_2MM_USB3_A; ConvertToPcb: yes
Q15 Q21 = AZ1045-04F: Manufacturer: TECH PUBLIC(台舟); Symbol: CM1293_1; AddInBom: yes; ModelId: 55525fa8fc914f7c8ffcb10749ea5f73; ModelName: DFN-10_L2.5-W1.0-H0.5-P0.50; ModelTransform: 40.1574,98.425,0,90,0,0,0,0,0; Type: ESD; Device: AZ1045-04F; LCSC Part Name: AZ1045-04F; SupplierPart: C2987152; ManufacturerPart: AZ1045-04F; Supplier Footprint: DFN2510-10; JLCPCB Part Class: Extended Part; Datasheet: https://atta.szlcsc.com/upload/public/pdf/source/20220406/8EAFF16680D4CFE618D2B8CBCD10F1DA.pdf; Supplier: LCSC; ConvertToPcb: yes; FootprintName: DFN2510P10E_2
Q22-Q24 = SRV05-4_C558418: 反向截止电压(Vrwm):5V;最大钳位电压:20V;峰值脉冲电流(Ipp)@10/1000us:3A;击穿电压:6V;; Manufacturer: TECH PUBLIC(台舟); Symbol: CM1293_0; AddInBom: yes; ModelId: 18da8f6c14a34920b3e136b5c401a119; ModelName: SOT-23-6_L2.9-W1.6-H1.5-LS2.8-P0.95; ModelTransform: 110.236,113.364,0,90,0,0,0.0005,0.0005,0; Reverse Stand-Off Voltage (Vrwm): 5V; Maximum Clamping Voltage: 20V; Peak Pulse Current (Ipp)@10/1000us: 3A; Breakdown Voltage: 6V; Type: ESD; Device: SRV05-4_C558418; LCSC Part Name: ESD，可防25kV静电; SupplierPart: C558418; ManufacturerPart: SRV05-4; Supplier Footprint: SOT-23-6; JLCPCB Part Class: Extended Part; Datasheet: https://atta.szlcsc.com/upload/public/pdf/source/20230615/CFFDFFE99FDA0E92DF9600783B3A2A20.pdf; Supplier: LCSC; ConvertToPcb: yes; FootprintName: SOT23-6P-20051228
R105 R107 R109 R110 R116-R119 R128-R135 = 0402WGF0000TCE: 电阻类型:厚膜电阻;阻值:0Ω;精度:±1%;功率:62.5mW;; Manufacturer: UNI-ROYAL(厚声); Symbol: 42A**-F; ModelId: 671aefced39d4c318694bba8bd8efd39; Tolerance: ±1%; AddInBom: yes; Power(Watts): 62.5mW; ModelName: R0402_L1.0-W0.5-H0.5; ModelTransform: 39.37,19.685,0,0,0,0,0,0.0005,0; Overload Voltage (Max): 50V; Temperature Coefficient: ±800ppm/℃; Device: 0402WGF0000TCE; PCB Footprint: R0402; Value: 0Ω; Type: 厚膜电阻; Supplier: LCSC; Datasheet: https://atta.szlcsc.com/upload/public/pdf/source/20200306/C422600_1E6D84923E4A46A82E41ADD87F860B5C.pdf; FootprintName: R0402; SupplierPart: C17168; ConvertToPcb: yes; LCSC Part Name: 0Ω ±1% 62.5mW; JLCPCB Part Class: Basic Part; ManufacturerPart: 0402WGF0000TCE; Supplier Footprint: 0402; Operating Temperature Range: -55℃~+155℃
R111-R114 R120-R127 R136 R141-R143 = 42A**-F_1: Manufacturer: UNI-ROYAL(厚声); Manufacturer Part: 0402WGF0000TCE; Add into BOM: no; PCB Footprint: R0402; 3D Model: 671aefced39d4c318694bba8bd8efd39; 3D Model Transform: 39.37,19.685,0,0,0,0,0,0.0005,0; Tolerance: ±1%; Power(Watts): 62.5mW; Overload Voltage (Max): 50V; Temperature Coefficient: ±800ppm/℃; Convert to PCB: no; Device: 42A**-F_1; Symbol: 42A**-F; LCSC Part Name: 0Ω ±1% 62.5mW 厚膜电阻; Supplier Part: C17168; Supplier Footprint: 0402; JLCPCB Part Class: Basic Part; Datasheet: https://atta.szlcsc.com/upload/public/pdf/source/20200306/C422600_1E6D84923E4A46A82E41ADD87F860B5C.pdf; Supplier: LCSC; Type: 厚膜电阻; Operating Temperature Range: -55℃~+155℃; FootprintName: R0402_2

## Sheet USB32 GEN1 5G_REAR.schdoc
size 420 x 298 mm; Symbol: Sheet-Symbol_A3; Company: 嘉立创EDA; Version: V1.0; Page Size: A3; @Project Name: 【全网首发】X86电脑主板_copy; @Page Count: 20; @Update Date: 2025-10-09; @Create Date: 2025-10-09; @Schematic Name: SCHEMATIC1_1; @Page No: 0; @Page Name: USB32 GEN1 5G_REAR; Device: Sheet-Symbol_A3
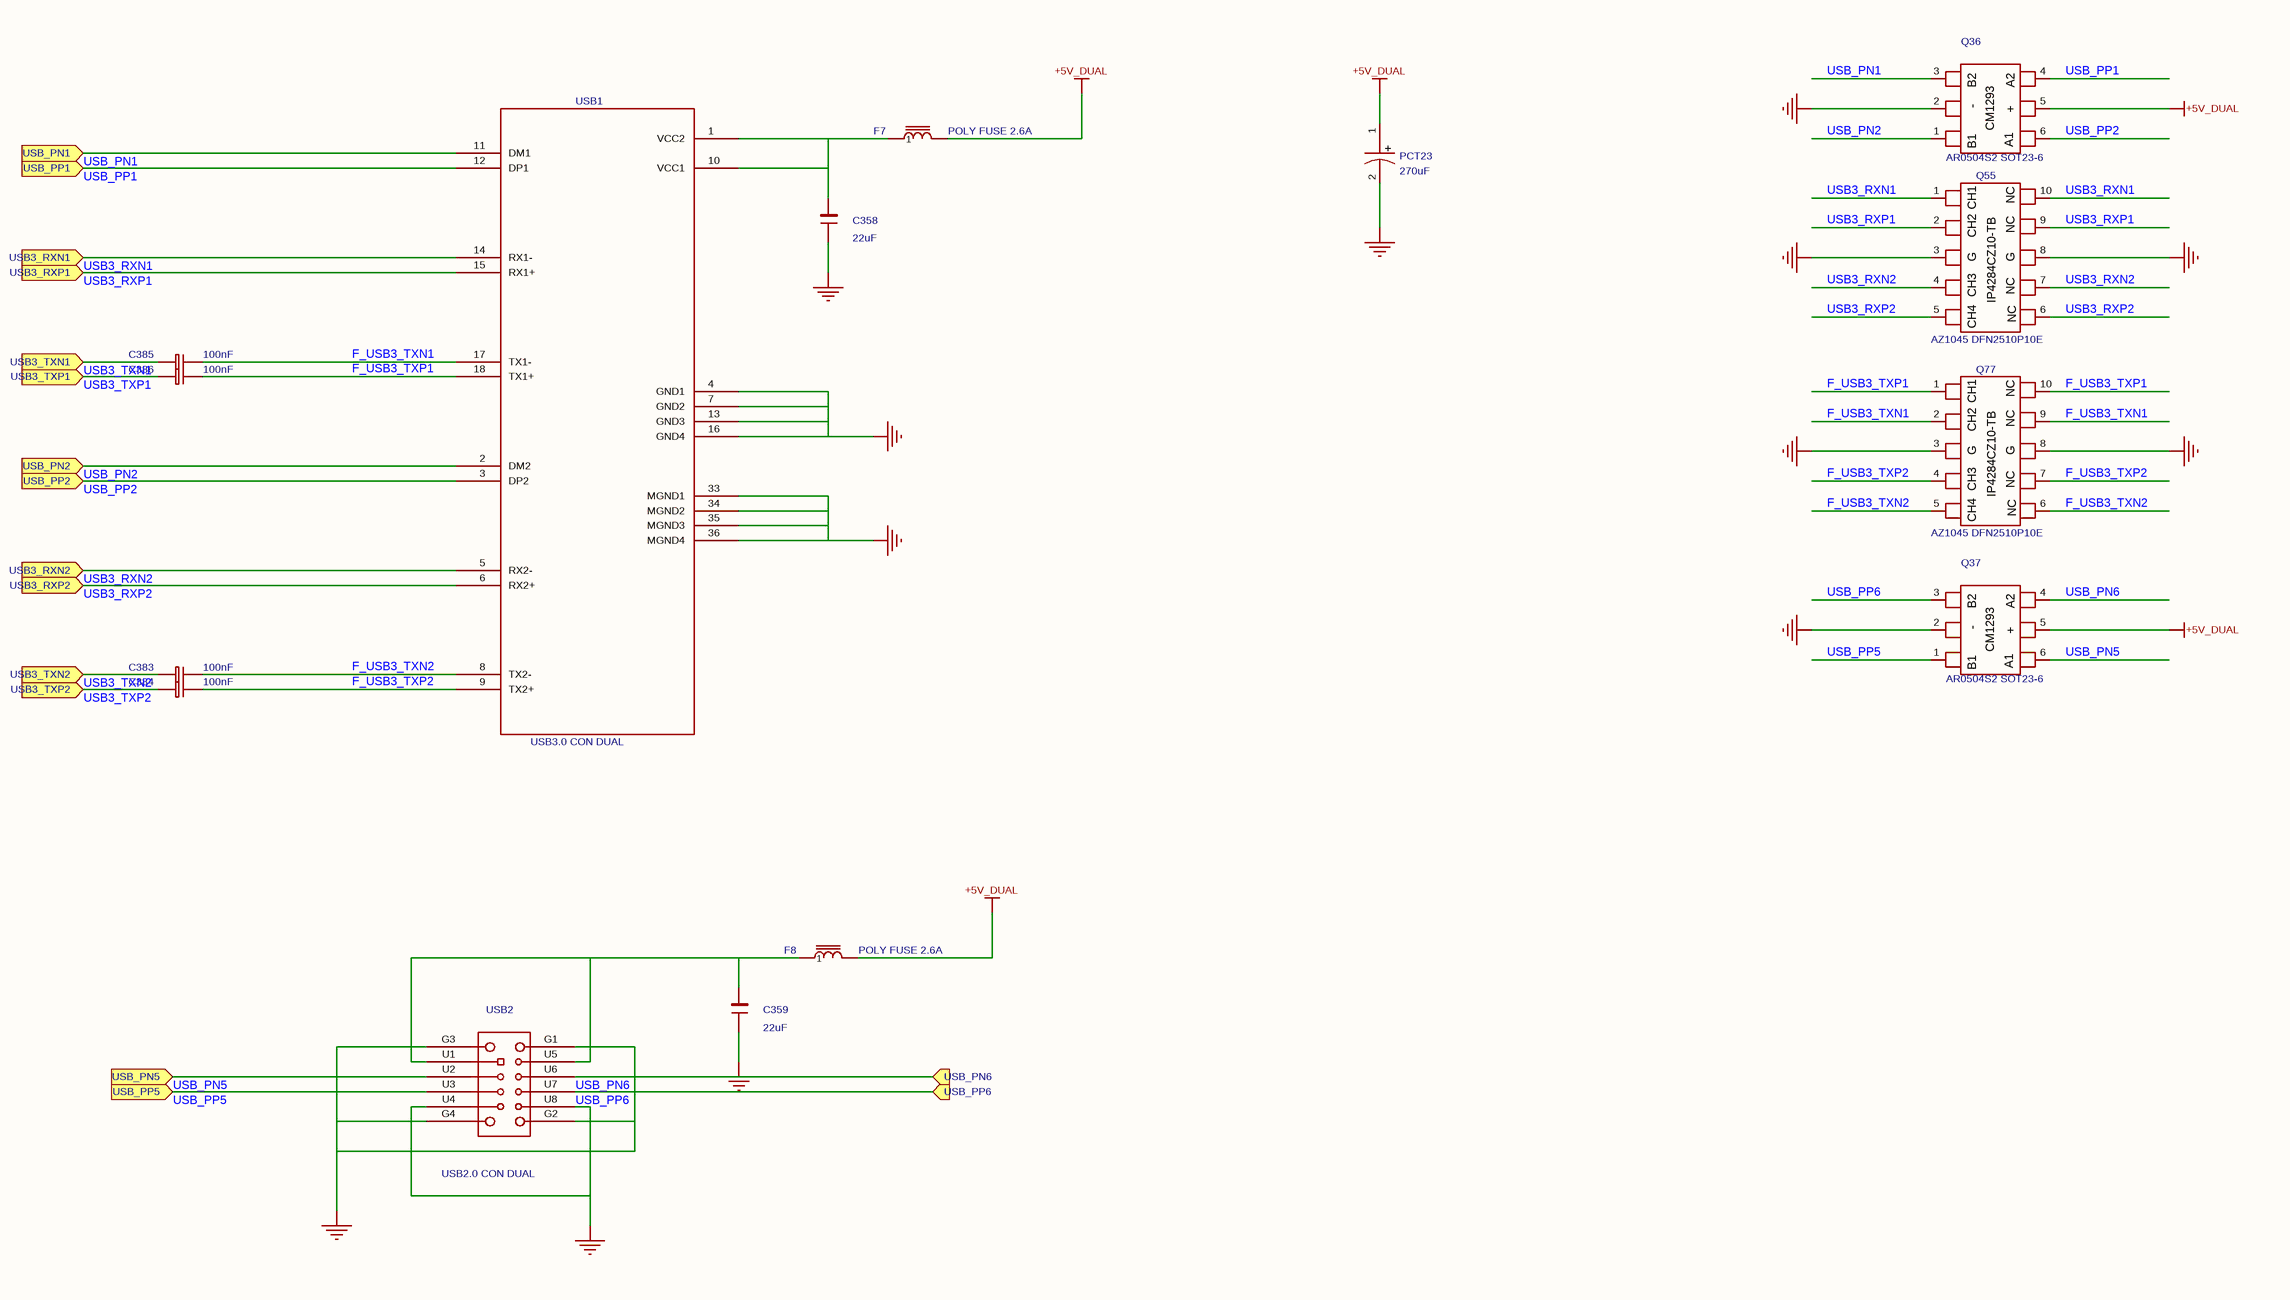
[diagram p34: USB32 GEN1 5G_REAR.schdoc]

### Parts
C358  22uF  [C0603]
C359  22uF  [C0603_1]
C383  100nF  [C0402]
C384  100nF  [C0402]
C385  100nF  [C0402]
C386  100nF  [C0402]
F7  value POLY FUSE 2.6A  [MINISMDC110]  (hidden comment: FERRITE BEAD)
F8  value POLY FUSE 2.6A  [MINISMDC110]  (hidden comment: FERRITE BEAD)
PCT23  270uF  [EC1P25C_2]
Q36  value AR0504S2 SOT23-6  [SOT23-6P-20051228_2]  (hidden comment: SRV05-4)
Q37  value AR0504S2 SOT23-6  [SOT23-6P-20051228_2]  (hidden comment: SRV05-4)
Q55  value AZ1045 DFN2510P10E  [DFN2510P10E]  (hidden comment: AZ1045-04F)
Q77  value AZ1045 DFN2510P10E  [DFN2510P10E_1]  (hidden comment: AZ1045-04F)
USB1  value USB3.0 CON DUAL  [USB3III]  (hidden comment: USB-303WSD-BRY)
USB2  value USB2.0 CON DUAL  [USB]  (hidden comment: USB-269-BRW)

### Ports
USB3_RXN1 (in), USB3_RXN2 (in), USB3_RXP1 (in), USB3_RXP2 (in), USB3_TXN1 (in), USB3_TXN2 (in), USB3_TXP1 (in), USB3_TXP2 (in), USB_PN1 (in), USB_PN2 (in), USB_PN5 (in), USB_PN6 (in), USB_PP1 (in), USB_PP2 (in), USB_PP5 (in), USB_PP6 (in)

### Nets
+5V_DUAL: F7.2 F8.2 PCT23.1 Q36.5(+) Q37.5(+)
GND: C358.2 C359.2 PCT23.2 Q36.2 Q37.2 Q55.3 Q55.8 Q77.3 Q77.8 USB1.4(GND1) USB1.7(GND2) USB1.13(GND3) USB1.16(GND4) USB1.33(MGND1) USB1.34(MGND2) USB1.35(MGND3) USB1.36(MGND4) USB2.G1(GNDG1) USB2.G2(GNDG2) USB2.G3(GNDG3) USB2.G4(GNDG4) USB2.U4 USB2.U8
F_USB3_TXN1: C385.1 Q77.2 Q77.9 USB1.17(TX1-)
F_USB3_TXN2: C383.1 Q77.5(+) Q77.6 USB1.8(TX2-)
F_USB3_TXP1: C386.1 Q77.1 Q77.10 USB1.18(TX1+)
F_USB3_TXP2: C384.1 Q77.4 Q77.7 USB1.9(TX2+)
USB3_RXN1: Q55.1 Q55.10 USB1.14(RX1-) ; port USB3_RXN1
USB3_RXN2: Q55.4 Q55.7 USB1.5(RX2-) ; port USB3_RXN2
USB3_RXP1: Q55.2 Q55.9 USB1.15(RX1+) ; port USB3_RXP1
USB3_RXP2: Q55.5(+) Q55.6 USB1.6(RX2+) ; port USB3_RXP2
USB3_TXN1: C385.2 ; port USB3_TXN1
USB3_TXN2: C383.2 ; port USB3_TXN2
USB3_TXP1: C386.2 ; port USB3_TXP1
USB3_TXP2: C384.2 ; port USB3_TXP2
USB_PN1: Q36.3 USB1.11(DM1) ; port USB_PN1
USB_PN2: Q36.1 USB1.2(DM2) ; port USB_PN2
USB_PN5: Q37.6 USB2.U2 ; port USB_PN5
USB_PN6: Q37.4 USB2.U6 ; port USB_PN6
USB_PP1: Q36.4 USB1.12(DP1) ; port USB_PP1
USB_PP2: Q36.6 USB1.3(DP2) ; port USB_PP2
USB_PP5: Q37.1 USB2.U3 ; port USB_PP5
USB_PP6: Q37.3 USB2.U7 ; port USB_PP6
NetC358_1: C358.1 F7.1 USB1.1(VCC2) USB1.10(VCC1)
NetC359_1: C359.1 F8.1 USB2.U1 USB2.U5

### Notes on the sheet
- 更新日期
- 2025-10-09
- 原理图
- 图页
- SCHEMATIC1_1
- USB32 GEN1 5G_REAR
- 创建日期
- 物料编码
- 审阅
- 绘制
- 【全网首发】X86电脑主板_copy
- 版本
- V1.0
- 尺寸
- A3
- 页
- 0
- 嘉立创EDA
- 共
- 20
- (in symbol 160AREC271M0609) +
- (in symbol AZ1045-04F) NC; CH1; CH2; G; CH3; IP4284CZ10-TB; CH4
- (in symbol SRV05-4_C558418) B2; A2; CM1293; -; B1; A1

### Library data of the parts
C358 C359 = CL10A226MQ8NRNC: 容值:22uF;精度:±20%;额定电压:6.3V;材质(温度系数):X5R;; Manufacturer: SAMSUNG(三星); Symbol: C0805; AddInBom: yes; Tolerance: ±20%; Voltage Rated: 6.3V; Temperature Coefficient: X5R; ModelId: ac125912035d415993ca9572d50418b1; ModelName: C0603_L1.6-W0.8-H0.8; ModelTransform: 62.992,31.496,0,0,0,0,0,0,0; Device: CL10A226MQ8NRNC; Value: 22uF; LCSC Part Name: 22uF ±20% 6.3V; SupplierPart: C59461; ManufacturerPart: CL10A226MQ8NRNC; Supplier Footprint: 0603; JLCPCB Part Class: Basic Part; Datasheet: https://atta.szlcsc.com/upload/public/pdf/source/20160218/1457707763339.pdf; Supplier: LCSC; ConvertToPcb: yes
  C358: FootprintName: C0603
  C359: FootprintName: C0603_1
C383-C386 = CC0402KRX7R7BB104: 容值:100nF;精度:±10%;额定电压:16V;材质(温度系数):X7R;; Manufacturer: YAGEO(国巨); Symbol: CAP NP_21; ModelId: 36a51122f27c49738f86b3bfa98863e0; Tolerance: ±10%; AddInBom: yes; Voltage Rated: 16V; ModelName: C0402_L1.0-W0.5-H0.5; ModelTransform: 39.37,19.685,0,0,0,0,0,0,0; Temperature Coefficient: X7R; Device: CC0402KRX7R7BB104; Value: 100nF; Supplier: LCSC; Datasheet: https://atta.szlcsc.com/upload/public/pdf/source/20211223/9278FD768280B81DDBEF48FA36411A03.pdf; FootprintName: C0402; SupplierPart: C60474; ConvertToPcb: yes; LCSC Part Name: 100nF ±10% 16V; JLCPCB Part Class: Extended Part; ManufacturerPart: CC0402KRX7R7BB104; Supplier Footprint: 0402
F7 F8 = FERRITE BEAD_3: Check: false; AddInBom: yes; Device: FERRITE BEAD_3; Symbol: FERRITE BEAD; FootprintName: MINISMDC110; ConvertToPcb: yes
PCT23 = 160AREC271M0609: as ECT10 on sheet USB32 GEN1 5G_FRONT; Device: 160AREC271M0609; Value: 270uF; LCSC Part Name: 270uF ±20% 16V; SupplierPart: C176312; ManufacturerPart: 160AREC271M0609; Supplier Footprint: 插件,D6.3xL9mm; JLCPCB Part Class: Extended Part; Datasheet: https://atta.szlcsc.com/upload/public/pdf/source/20180420/C176312_A6CC051F3F5535015096354530D22B11.pdf; Supplier: LCSC; ConvertToPcb: yes; FootprintName: EC1P25C_2; Ripple Current: 3.8A@100kHz; Equivalent Series Resistance(ESR): 15mΩ@100kHz~300kHz; Type: -; Lead Spacing: 2.5mm; Operating Temperature: -55℃~+105℃
Q36 Q37 = SRV05-4_C558418: as Q22-Q24 on sheet USB32 GEN1 5G_FRONT; Device: SRV05-4_C558418; LCSC Part Name: ESD，可防25kV静电; SupplierPart: C558418; ManufacturerPart: SRV05-4; Supplier Footprint: SOT-23-6; JLCPCB Part Class: Extended Part; Datasheet: https://atta.szlcsc.com/upload/public/pdf/source/20230615/CFFDFFE99FDA0E92DF9600783B3A2A20.pdf; Supplier: LCSC; ConvertToPcb: yes; FootprintName: SOT23-6P-20051228_2
Q55 Q77 = AZ1045-04F: as Q15 on sheet USB32 GEN1 5G_FRONT; Device: AZ1045-04F; LCSC Part Name: AZ1045-04F; SupplierPart: C2987152; ManufacturerPart: AZ1045-04F; Supplier Footprint: DFN2510-10; JLCPCB Part Class: Extended Part; Datasheet: https://atta.szlcsc.com/upload/public/pdf/source/20220406/8EAFF16680D4CFE618D2B8CBCD10F1DA.pdf; Supplier: LCSC; ConvertToPcb: yes
  Q55: FootprintName: DFN2510P10E
  Q77: FootprintName: DFN2510P10E_1
USB1 = USB-303WSD-BRY: 连接器类型:Type-A;标准:USB 3.0;公母:母;端口数量:2;触点数量:9P+9P;安装方式:弯插;额定电流 - 电源:1.8A;工作温度范围:-30℃~+85℃;焊接温度(最大值):260℃;; Manufacturer: XUNPU(讯普); Symbol: REAR USB 3_0.0; AddInBom: yes; ModelId: 099f7116bbdc404e98854c37ac96170a; ModelName: USB-A-TH_XUNPU_USB-303WSD-BRY; ModelTransform: 614.147,688.975,0,0,0,0,0,-166.339,-118.11; Connector Type: Type-A; Gender: 母; Number of Ports: 2; Number of Contacts: 9P+9P; Current Rating - Power (Max): 1.8A; Soldering Temperature(Max): 260℃; Device: USB-303WSD-BRY; LCSC Part Name: Type-A 母 弯插; SupplierPart: C2895028; ManufacturerPart: USB-303WSD-BRY; Supplier Footprint: 插件; JLCPCB Part Class: Extended Part; Datasheet: https://atta.szlcsc.com/upload/public/pdf/source/20230426/A73C665BA3413059F595E5846F1512B5.pdf; Supplier: LCSC; ConvertToPcb: yes; FootprintName: USB3III; Standard: USB 3.0; Mounting Style: 弯插; Operating Temperature Range: -30℃~+85℃
USB2 = USB-269-BRW: 连接器类型:Type-A;标准:USB 2.0;公母:母座;触点数量:4+4;端口数量:2;安装方式:弯插;额定电流 - 电源:1.5A;触头材质:-;触头镀层:-;工作温度范围:-20℃~+70℃;焊接温度(最大值):260℃;; Manufacturer: XUNPU(讯普); Symbol: USB_PORT_0; Gender: 母座; ModelId: 6e8712a987fe4b7299da11213ca5dd28; AddInBom: yes; ModelName: USB-A-TH_USB-269-BRW; Connector Type: Type-A; Number of Ports: 2; ModelTransform: 614.14798,677.164,0,0,0,0,0,181.102,-157.48; Number of Contacts: 4+4; Welding Temperature (Max): 260℃; Current Rating - Power (Max): 1.5A; Device: USB-269-BRW; Standard: USB 2.0; Supplier: LCSC; FootprintName: USB; SupplierPart: C720548; ConvertToPcb: yes; LCSC Part Name: Type-A 母座 弯插; Mounting Style: 弯插; Contact Plating: -; Contact Material: -; JLCPCB Part Class: Extended Part; ManufacturerPart: USB-269-BRW; Supplier Footprint: 插件; Operating Temperature Range: -20℃~+70℃